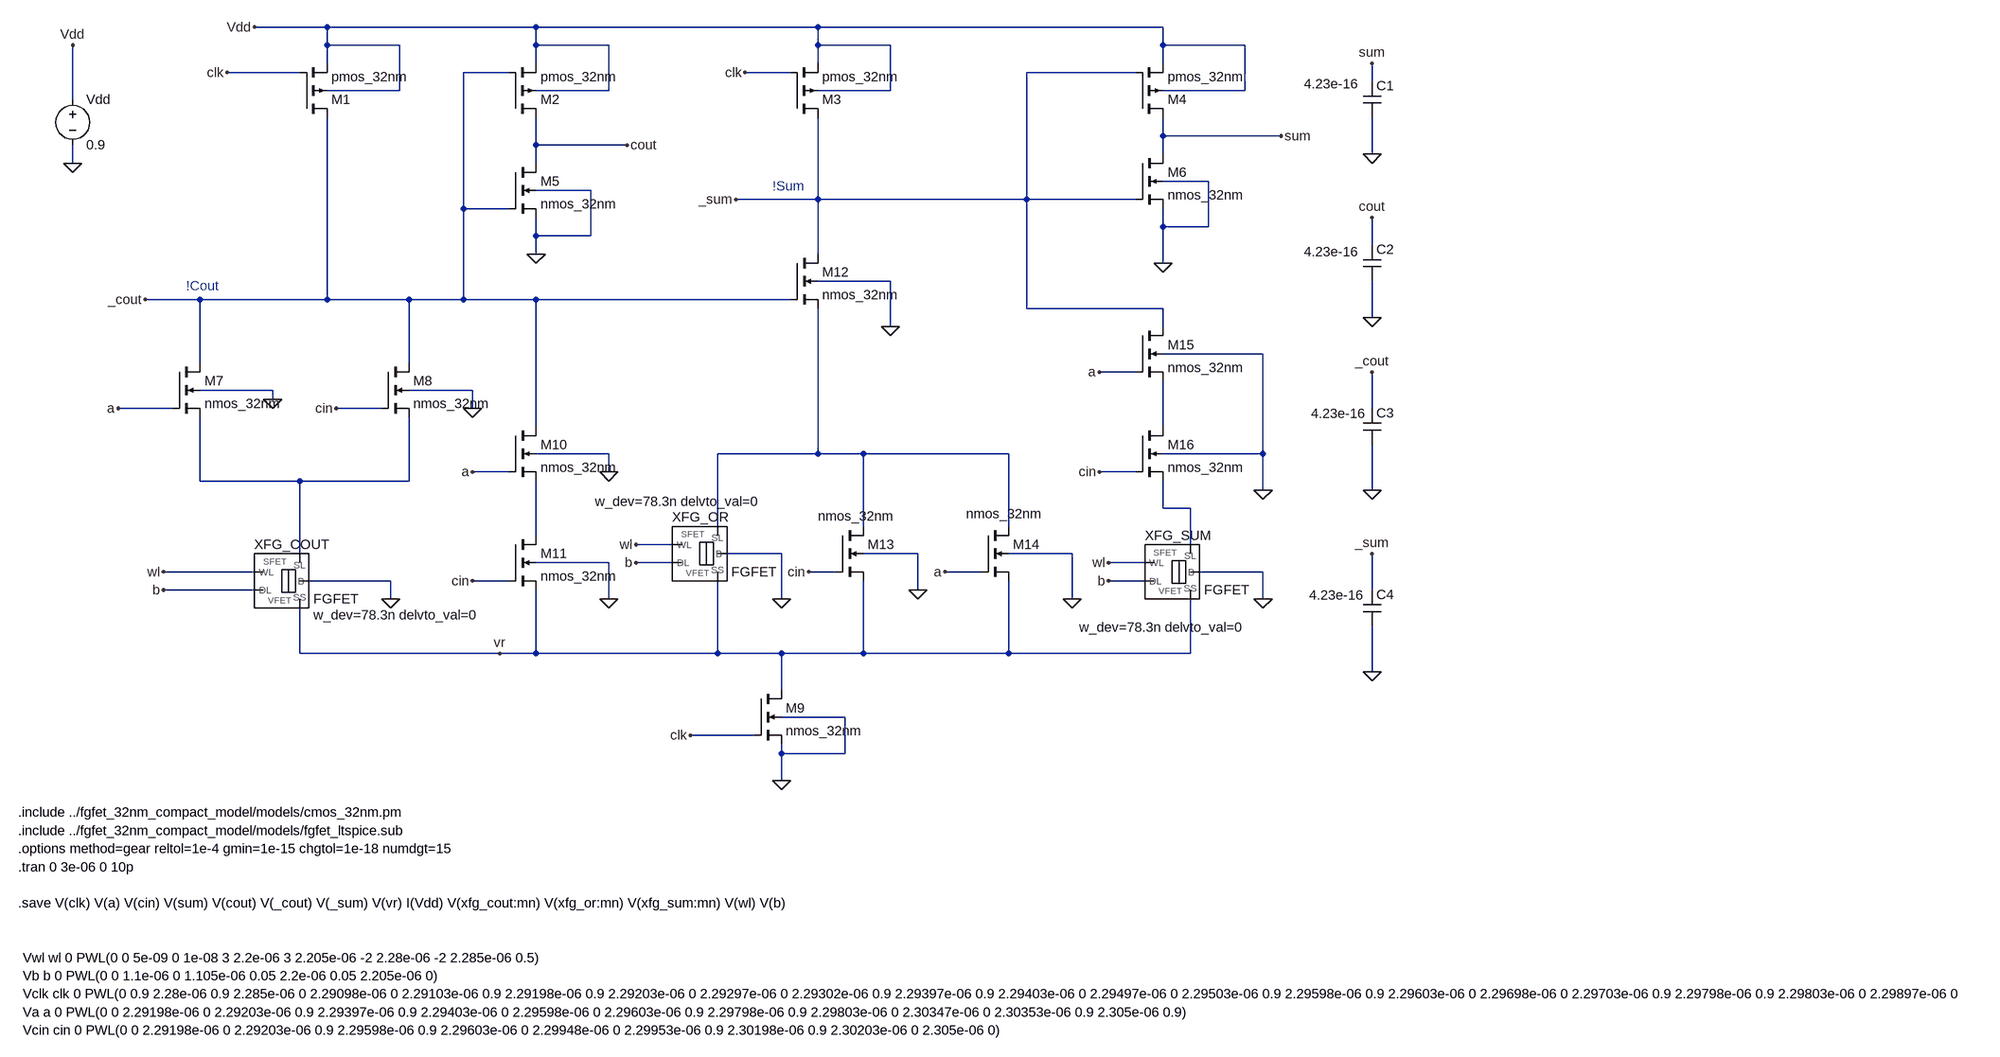
[diagram p0: schematic full_adder_atype.asc]
full_adder_atype.asc, the LTspice schematic file:
Version 4.1
SHEET 1 3980 1464
WIRE -320 -320 -448 -320
WIRE 48 -320 -320 -320
WIRE 544 -320 48 -320
WIRE 1152 -320 544 -320
WIRE -320 -288 -320 -320
WIRE -192 -288 -320 -288
WIRE 48 -288 48 -320
WIRE 176 -288 48 -288
WIRE 544 -288 544 -320
WIRE 672 -288 544 -288
WIRE 1152 -288 1152 -320
WIRE 1296 -288 1152 -288
WIRE -320 -256 -320 -288
WIRE 48 -256 48 -288
WIRE 544 -256 544 -288
WIRE 1152 -256 1152 -288
WIRE -368 -240 -496 -240
WIRE 0 -240 -80 -240
WIRE 496 -240 416 -240
WIRE 1104 -240 912 -240
WIRE 1520 -224 1520 -256
WIRE -192 -208 -192 -288
WIRE -192 -208 -320 -208
WIRE 176 -208 176 -288
WIRE 176 -208 48 -208
WIRE 672 -208 672 -288
WIRE 672 -208 544 -208
WIRE 1296 -208 1296 -288
WIRE 1296 -208 1152 -208
WIRE -768 -192 -768 -288
WIRE 1152 -128 1152 -160
WIRE 1360 -128 1152 -128
WIRE 48 -112 48 -160
WIRE 208 -112 48 -112
WIRE 1152 -96 1152 -128
WIRE 1520 -96 1520 -160
WIRE -768 -80 -768 -112
WIRE 48 -80 48 -112
WIRE 1232 -48 1152 -48
WIRE 144 -32 48 -32
WIRE 544 -16 544 -160
WIRE 544 -16 400 -16
WIRE 912 -16 912 -240
WIRE 912 -16 544 -16
WIRE 1104 -16 912 -16
WIRE -80 0 -80 -240
WIRE 0 0 -80 0
WIRE 1152 32 1152 0
WIRE 1232 32 1232 -48
WIRE 1232 32 1152 32
WIRE 48 48 48 16
WIRE 144 48 144 -32
WIRE 144 48 48 48
WIRE 1520 64 1520 16
WIRE 48 80 48 48
WIRE 544 80 544 -16
WIRE 1152 96 1152 32
WIRE 672 128 544 128
WIRE -544 160 -640 160
WIRE -320 160 -320 -160
WIRE -320 160 -544 160
WIRE -176 160 -320 160
WIRE -80 160 -80 0
WIRE -80 160 -176 160
WIRE 48 160 -80 160
WIRE 496 160 48 160
WIRE 912 176 912 -16
WIRE 1152 176 912 176
WIRE 1520 192 1520 128
WIRE 672 208 672 128
WIRE 1152 208 1152 176
WIRE 1328 256 1152 256
WIRE -544 272 -544 160
WIRE -176 272 -176 160
WIRE 1104 288 1040 288
WIRE -416 320 -544 320
WIRE -64 320 -176 320
WIRE -416 336 -416 320
WIRE -592 352 -688 352
WIRE -224 352 -304 352
WIRE -64 352 -64 320
WIRE 1520 352 1520 288
WIRE 48 384 48 160
WIRE 1152 384 1152 304
WIRE 176 432 48 432
WIRE 544 432 544 176
WIRE 544 432 368 432
WIRE 624 432 544 432
WIRE 880 432 624 432
WIRE 1328 432 1328 256
WIRE 1328 432 1152 432
WIRE 0 464 -64 464
WIRE 176 464 176 432
WIRE 1104 464 1040 464
WIRE -544 480 -544 368
WIRE -368 480 -544 480
WIRE -176 480 -176 368
WIRE -176 480 -368 480
WIRE 1328 496 1328 432
WIRE 1520 496 1520 416
WIRE 1152 528 1152 480
WIRE 1200 528 1152 528
WIRE 368 560 368 432
WIRE 624 560 624 432
WIRE 880 560 880 432
WIRE 48 576 48 480
WIRE 288 592 224 592
WIRE 1200 592 1200 528
WIRE -368 608 -368 480
WIRE 480 608 384 608
WIRE 720 608 624 608
WIRE 992 608 880 608
WIRE 176 624 48 624
WIRE 288 624 224 624
WIRE 1120 624 1056 624
WIRE -448 640 -608 640
WIRE 576 640 528 640
WIRE 832 640 768 640
WIRE 1328 640 1216 640
WIRE -208 656 -352 656
WIRE 0 656 -64 656
WIRE 1120 656 1056 656
WIRE -448 672 -608 672
WIRE 720 672 720 608
WIRE 1520 672 1520 608
WIRE -208 688 -208 656
WIRE 176 688 176 624
WIRE 480 688 480 608
WIRE 992 688 992 608
WIRE 1328 688 1328 640
WIRE -368 784 -368 704
WIRE -16 784 -368 784
WIRE 48 784 48 672
WIRE 48 784 -16 784
WIRE 368 784 368 656
WIRE 368 784 48 784
WIRE 480 784 368 784
WIRE 624 784 624 656
WIRE 624 784 480 784
WIRE 880 784 880 656
WIRE 880 784 624 784
WIRE 1200 784 1200 688
WIRE 1200 784 880 784
WIRE 1520 816 1520 736
WIRE 480 848 480 784
WIRE 592 896 480 896
WIRE 432 928 320 928
WIRE 480 960 480 944
WIRE 592 960 592 896
WIRE 592 960 480 960
WIRE 480 1008 480 960
FLAG -768 -80 0
FLAG -768 -288 Vdd
FLAG -448 -320 Vdd
FLAG 48 80 0
FLAG 1152 96 0
FLAG 208 -112 cout
FLAG 1360 -128 sum
FLAG -688 352 a
FLAG -304 352 cin
FLAG -608 640 wl
FLAG -608 672 b
FLAG -208 688 0
FLAG 480 1008 0
FLAG 320 928 clk
FLAG -64 464 a
FLAG -64 656 cin
FLAG 528 640 cin
FLAG 768 640 a
FLAG 224 592 wl
FLAG 224 624 b
FLAG -416 336 0
FLAG -64 352 0
FLAG 176 464 0
FLAG 176 688 0
FLAG 720 672 0
FLAG 992 688 0
FLAG 480 688 0
FLAG 672 208 0
FLAG 1040 288 a
FLAG 1040 464 cin
FLAG 1056 624 wl
FLAG 1056 656 b
FLAG 1328 688 0
FLAG 1328 496 0
FLAG 1520 -96 0
FLAG 1520 192 0
FLAG 1520 496 0
FLAG 1520 816 0
FLAG 1520 -256 sum
FLAG 1520 16 cout
FLAG -640 160 _cout
FLAG 400 -16 _sum
FLAG 1520 288 _cout
FLAG 1520 608 _sum
FLAG -16 784 vr
FLAG -496 -240 clk
FLAG 416 -240 clk
SYMBOL voltage -768 -208 R0
SYMATTR InstName Vdd
SYMATTR Value 0.9
SYMBOL nmos4 0 -80 R0
SYMATTR InstName M5
SYMATTR Value nmos_32nm
SYMATTR Value2 l=32n w=195n
SYMBOL nmos4 1104 -96 R0
SYMATTR InstName M6
SYMATTR Value nmos_32nm
SYMATTR Value2 l=32n w=195n
SYMBOL nmos4 -592 272 R0
SYMATTR InstName M7
SYMATTR Value nmos_32nm
SYMATTR Value2 l=32n w=64n
SYMBOL nmos4 -224 272 R0
SYMATTR InstName M8
SYMATTR Value nmos_32nm
SYMATTR Value2 l=32n w=64n
SYMBOL FGFET -416 608 R0
WINDOW 39 72 108 Left 2
SYMATTR SpiceLine w_dev=78.3n delvto_val=0
SYMATTR InstName XFG_COUT
SYMBOL nmos4 432 848 R0
SYMATTR InstName M9
SYMATTR Value nmos_32nm
SYMATTR Value2 l=32n w=64n
SYMBOL nmos4 0 384 R0
SYMATTR InstName M10
SYMATTR Value nmos_32nm
SYMATTR Value2 l=32n w=64n
SYMBOL nmos4 0 576 R0
SYMATTR InstName M11
SYMATTR Value nmos_32nm
SYMATTR Value2 l=32n w=64n
SYMBOL nmos4 496 80 R0
SYMATTR InstName M12
SYMATTR Value nmos_32nm
SYMATTR Value2 l=32n w=64n
SYMBOL nmos4 576 560 R0
WINDOW 3 -32 -18 Left 2
SYMATTR Value nmos_32nm
SYMATTR InstName M13
SYMATTR Value2 l=32n w=64n
SYMBOL nmos4 832 560 R0
WINDOW 3 -27 -22 Left 2
SYMATTR Value nmos_32nm
SYMATTR InstName M14
SYMATTR Value2 l=32n w=64n
SYMBOL FGFET 320 560 R0
WINDOW 39 -168 -44 Left 2
SYMATTR SpiceLine w_dev=78.3n delvto_val=0
SYMATTR InstName XFG_OR
SYMBOL nmos4 1104 208 R0
SYMATTR InstName M15
SYMATTR Value nmos_32nm
SYMATTR Value2 l=32n w=64n
SYMBOL nmos4 1104 384 R0
SYMATTR InstName M16
SYMATTR Value nmos_32nm
SYMATTR Value2 l=32n w=64n
SYMBOL FGFET 1152 592 R0
WINDOW 39 -148 146 Left 2
SYMATTR SpiceLine w_dev=78.3n delvto_val=0
SYMATTR InstName XFG_SUM
SYMBOL cap 1504 -224 R0
WINDOW 3 -104 4 Left 2
SYMATTR Value 4.23e-16
SYMATTR InstName C1
SYMBOL cap 1504 64 R0
WINDOW 3 -104 12 Left 2
SYMATTR Value 4.23e-16
SYMATTR InstName C2
SYMBOL cap 1504 352 R0
WINDOW 3 -91 9 Left 2
SYMATTR Value 4.23e-16
SYMATTR InstName C3
SYMBOL cap 1504 672 R0
WINDOW 3 -95 9 Left 2
SYMATTR Value 4.23e-16
SYMATTR InstName C4
SYMBOL pmos4 -368 -160 M180
SYMATTR InstName M1
SYMATTR Value pmos_32nm
SYMATTR Value2 l=32n w=84.4n
SYMBOL pmos4 0 -160 M180
SYMATTR InstName M2
SYMATTR Value pmos_32nm
SYMATTR Value2 l=32n w=342n
SYMBOL pmos4 496 -160 M180
SYMATTR InstName M3
SYMATTR Value pmos_32nm
SYMATTR Value2 l=32n w=84.4n
SYMBOL pmos4 1104 -160 M180
SYMATTR InstName M4
SYMATTR Value pmos_32nm
SYMATTR Value2 l=32n w=342n
TEXT -568 136 Left 2 ;!Cout
TEXT 464 -40 Left 2 ;!Sum
TEXT -864 1064 Left 2 !.include ../fgfet_32nm_compact_model/models/cmos_32nm.pm
TEXT -864 1096 Left 2 !.include ../fgfet_32nm_compact_model/models/fgfet_ltspice.sub
TEXT -864 1128 Left 2 !.options method=gear reltol=1e-4 gmin=1e-15 chgtol=1e-18 numdgt=15
TEXT -864 1160 Left 2 !.tran 0 3e-06 0 10p
TEXT -856 1320 Left 2 !Vwl wl 0 PWL(0 0 5e-09 0 1e-08 3 2.2e-06 3 2.205e-06 -2 2.28e-06 -2 2.285e-06 0.5)
TEXT -856 1352 Left 2 !Vb b 0 PWL(0 0 1.1e-06 0 1.105e-06 0.05 2.2e-06 0.05 2.205e-06 0)
TEXT -856 1416 Left 2 !Va a 0 PWL(0 0 2.29198e-06 0 2.29203e-06 0.9 2.29397e-06 0.9 2.29403e-06 0 2.29598e-06 0 2.29603e-06 0.9 2.29798e-06 0.9 2.29803e-06 0 2.30347e-06 0 2.30353e-06 0.9 2.305e-06 0.9)
TEXT -856 1384 Left 2 !Vclk clk 0 PWL(0 0.9 2.28e-06 0.9 2.285e-06 0 2.29098e-06 0 2.29103e-06 0.9 2.29198e-06 0.9 2.29203e-06 0 2.29297e-06 0 2.29302e-06 0.9 2.29397e-06 0.9 2.29403e-06 0 2.29497e-06 0 2.29503e-06 0.9 2.29598e-06 0.9 2.29603e-06 0 2.29698e-06 0 2.29703e-06 0.9 2.29798e-06 0.9 2.29803e-06 0 2.29897e-06 0 2.29902e-06 0.9 2.30198e-06 0.9 2.30203e-06 0 2.30298e-06 0 2.30303e-06 0.9 2.305e-06 0.9)
TEXT -856 1448 Left 2 !Vcin cin 0 PWL(0 0 2.29198e-06 0 2.29203e-06 0.9 2.29598e-06 0.9 2.29603e-06 0 2.29948e-06 0 2.29953e-06 0.9 2.30198e-06 0.9 2.30203e-06 0 2.305e-06 0)
TEXT -864 1224 Left 2 !.save V(clk) V(a) V(cin) V(sum) V(cout) V(_cout) V(_sum) V(vr) I(Vdd) V(xfg_cout:mn) V(xfg_or:mn) V(xfg_sum:mn) V(wl) V(b)

The netlist it stands for:
* full_adder_atype.asc
Vdd Vdd 0 0.9
M5 cout _cout 0 0 nmos_32nm l=32n w=195n
M6 sum _sum 0 0 nmos_32nm l=32n w=195n
M7 _cout a N003 0 nmos_32nm l=32n w=64n
M8 _cout cin N003 0 nmos_32nm l=32n w=64n
X§XFG_COUT wl b N003 vr 0 FGFET w_dev=78.3n delvto_val=0  ; pins WL DL SL SS B
M9 vr clk 0 0 nmos_32nm l=32n w=64n
M10 _cout a N005 0 nmos_32nm l=32n w=64n
M11 N005 cin vr 0 nmos_32nm l=32n w=64n
M12 _sum _cout N002 0 nmos_32nm l=32n w=64n
M13 N002 cin vr 0 nmos_32nm l=32n w=64n
M14 N002 a vr 0 nmos_32nm l=32n w=64n
X§XFG_OR wl b N002 vr 0 FGFET w_dev=78.3n delvto_val=0  ; pins WL DL SL SS B
M15 _sum a N001 0 nmos_32nm l=32n w=64n
M16 N001 cin N004 0 nmos_32nm l=32n w=64n
X§XFG_SUM wl b N004 vr 0 FGFET w_dev=78.3n delvto_val=0  ; pins WL DL SL SS B
C1 sum 0 4.23e-16
C2 cout 0 4.23e-16
C3 _cout 0 4.23e-16
C4 _sum 0 4.23e-16
M1 _cout clk Vdd Vdd pmos_32nm l=32n w=84.4n
M2 cout _cout Vdd Vdd pmos_32nm l=32n w=342n
M3 _sum clk Vdd Vdd pmos_32nm l=32n w=84.4n
M4 sum _sum Vdd Vdd pmos_32nm l=32n w=342n
.model NMOS NMOS
.model PMOS PMOS
.lib standard.mos
* !Cout
* !Sum
.include ../fgfet_32nm_compact_model/models/cmos_32nm.pm
.include ../fgfet_32nm_compact_model/models/fgfet_ltspice.sub
.options method=gear reltol=1e-4 gmin=1e-15 chgtol=1e-18 numdgt=15
.tran 0 3e-06 0 10p
Vwl wl 0 PWL(0 0 5e-09 0 1e-08 3 2.2e-06 3 2.205e-06 -2 2.28e-06 -2 2.285e-06 0.5)
Vb b 0 PWL(0 0 1.1e-06 0 1.105e-06 0.05 2.2e-06 0.05 2.205e-06 0)
Va a 0 PWL(0 0 2.29198e-06 0 2.29203e-06 0.9 2.29397e-06 0.9 2.29403e-06 0 2.29598e-06 0 2.29603e-06 0.9 2.29798e-06 0.9 2.29803e-06 0 2.30347e-06 0 2.30353e-06 0.9 2.305e-06 0.9)
Vclk clk 0 PWL(0 0.9 2.28e-06 0.9 2.285e-06 0 2.29098e-06 0 2.29103e-06 0.9 2.29198e-06 0.9 2.29203e-06 0 2.29297e-06 0 2.29302e-06 0.9 2.29397e-06 0.9 2.29403e-06 0 2.29497e-06 0 2.29503e-06 0.9 2.29598e-06 0.9 2.29603e-06 0 2.29698e-06 0 2.29703e-06 0.9 2.29798e-06 0.9 2.29803e-06 0 2.29897e-06 0 2.29902e-06 0.9 2.30198e-06 0.9 2.30203e-06 0 2.30298e-06 0 2.30303e-06 0.9 2.305e-06 0.9)
Vcin cin 0 PWL(0 0 2.29198e-06 0 2.29203e-06 0.9 2.29598e-06 0.9 2.29603e-06 0 2.29948e-06 0 2.29953e-06 0.9 2.30198e-06 0.9 2.30203e-06 0 2.305e-06 0)
.save V(clk) V(a) V(cin) V(sum) V(cout) V(_cout) V(_sum) V(vr) I(Vdd) V(xfg_cout:mn) V(xfg_or:mn) V(xfg_sum:mn) V(wl) V(b)
.backanno
.end